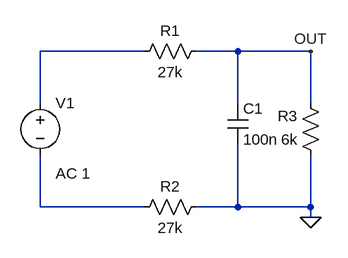
[diagram p0: schematic adc_input_filter.asc]
adc_input_filter.asc, the LTspice schematic file:
Version 4
SHEET 1 880 680
WIRE 80 96 -80 96
WIRE 224 96 160 96
WIRE 336 96 224 96
WIRE -80 176 -80 96
WIRE 224 176 224 96
WIRE 336 176 336 96
WIRE -80 336 -80 256
WIRE 80 336 -80 336
WIRE 224 336 224 240
WIRE 224 336 160 336
WIRE 336 336 336 256
WIRE 336 336 224 336
WIRE 336 352 336 336
FLAG 336 352 0
FLAG 336 96 OUT
SYMBOL res 176 80 R90
WINDOW 0 0 56 VBottom 2
WINDOW 3 32 56 VTop 2
SYMATTR InstName R1
SYMATTR Value 27k
SYMBOL res 176 320 R90
WINDOW 0 0 56 VBottom 2
WINDOW 3 32 56 VTop 2
SYMATTR InstName R2
SYMATTR Value 27k
SYMBOL res 352 272 R180
WINDOW 0 36 76 Left 2
WINDOW 3 36 40 Left 2
SYMATTR InstName R3
SYMATTR Value 6k
SYMBOL cap 208 176 R0
SYMATTR InstName C1
SYMATTR Value 100n
SYMBOL voltage -80 160 R0
WINDOW 123 24 124 Left 2
WINDOW 39 0 0 Left 0
SYMATTR InstName V1
SYMATTR Value ""
SYMATTR Value2 AC 1

The netlist it stands for:
* adc_input_filter.asc
R1 OUT N001 27k
R2 0 N002 27k
R3 0 OUT 6k
C1 OUT 0 100n
V1 N001 N002 AC 1
.backanno
.end